# Altium schematic sheet LevelTranslator.SchDoc
size A4; SheetNumber: 1; SheetTotal: 1
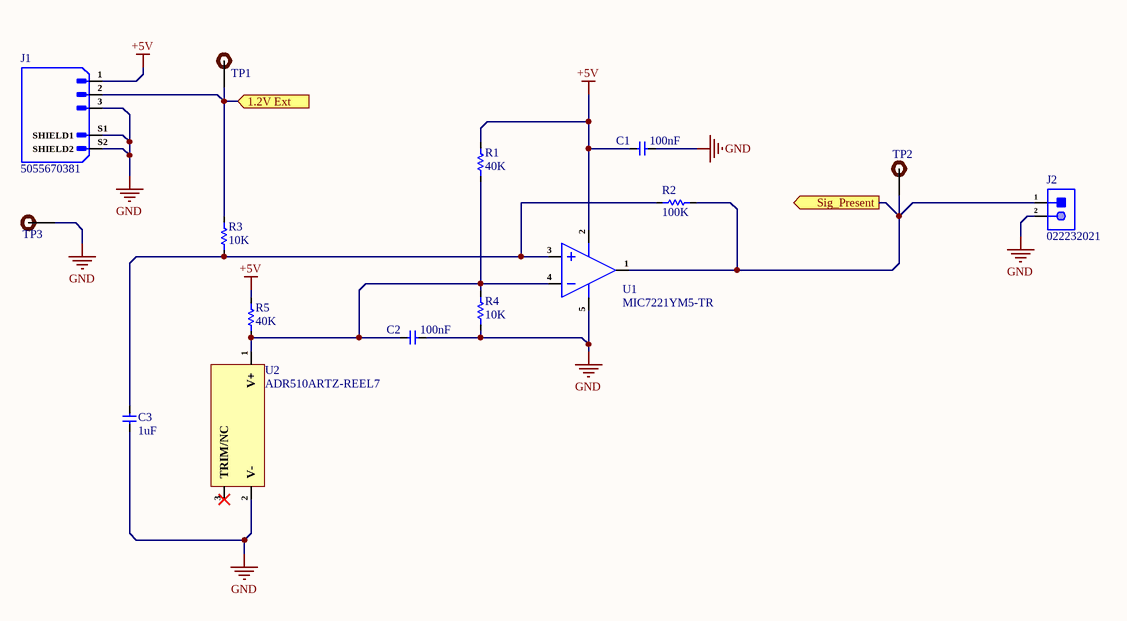
[diagram p0: LevelTranslator.SchDoc]

## Parts
C1  100nF  [Cap-0402]
C2  100nF  [Cap-0402]
C3  1uF  [Cap-0603]
J1  5055670381  [5055670381]
J2  022232021  [022232021]
R1  40K  [Res-0402]
R2  100K  [Res-0402]
R3  10K  [Res-0402]
R4  10K  [Res-0402]
R5  40K  [Res-0402]
TP1  0.5mm Test Pad  [0.5mm Test Pad]  (value not drawn)
TP2  0.5mm Test Pad  [0.5mm Test Pad]  (value not drawn)
TP3  0.5mm Test Pad  [0.5mm Test Pad]  (value not drawn)
U1  MIC7221YM5-TR  [SOT-23-5]
U2  ADR510ARTZ-REEL7  [SOT-23]

## Ports
1.2V Ext (in), Sig_Present (out)

## Nets
+5V: C1.1 J1.1 R1.2 R5.2 U1.2(V+)
GND: C1.2 C2.2 C3.1 J1.3 J1.S1(SHIELD1) J1.S2(SHIELD2) J2.2 R4.1 TP3.1 U1.5(V-) U2.2(V-)
1.2V Ext: J1.2 R3.2 TP1.1 ; port 1.2V Ext
Sig_Present: J2.1 R2.2 TP2.1 U1.1(OUT) ; port Sig_Present
NetC2_1: C2.1 R1.1 R4.2 R5.1 U1.4(IN-) U2.1(V+)
NetC3_2: C3.2 R2.1 R3.1 U1.3(IN+)

Not connected (* = marked no-connect by the designer): U2 3(TRIM/NC)*

## Notes on the sheet
- File:
- Title:
- Date:
- Page
- Num:
- Total:
- Drawn By: Huzaifa Ali

## Library data of the parts
C1 C2 = CC0402KRX5R8BB104: CAP CER 0.1UF 25V X5R 0402; Manufacturer: Yageo; Tolerance: 10%; Item Type: Capacitor; Supplier 1: Digi-Key; Manufacturer Part Number: CC0402KRX5R8BB104; RoHS: Yes; Category: Ceramic Capacitors; Stock 1: 4598218; Pricing 1: 1=0.10000, 10=0.03800, 50=0.02100, 100=0.01710, 500=0.01224, 1000=0.00961, 2500=0.00874, 5000=0.00804 (USD); Mount: Surface Mount; Case/Package: 0402; Case Code (Metric): 1005; Case Code (Imperial): 0402; Min Operating Temperature: -55°C; Max Operating Temperature: 85°C; Voltage Rating: 25V; Packaging: Tape and Reel; Capacitance: 100nF; Voltage Rating (DC): 25V; Dielectric: X5R; Resistor Type: Ceramic; Series: CC; Length: 0.039inch; Width: 0.02inch; Thickness: 0.022inch; Depth: 0.5mm; Lead Free: Lead Free; Halogen Free: Halogen Free; RoHS Compliant: Yes; ComponentLink1URL: http://www.mouser.com/ds/2/447/UPY-GPHC_X5R_4V-to-50V_25-1131599.pdf?src-supplier=Mouser; ComponentLink1Description: http://www.mouser.com/ds/2/447/UPY-GPHC_X5R_4V-to-50V_25-1131599.pdf?src-supplier=Mouser; ComponentLink2URL: http://www.yageo.com/documents/recent/UPY-GPHC_X5R_4V-to-50V-16.pdf?src-supplier=Future+Electronics; ComponentLink2Description: http://www.yageo.com/documents/recent/UPY-GPHC_X5R_4V-to-50V-16.pdf?src-supplier=Future+Electronics; ComponentLink3URL: http://www.yageo.com/documents/recent/UPY-GPHC_X5R_4V-to-50V_25.pdf?src-supplier=Digi-Key; ComponentLink3Description: http://www.yageo.com/documents/recent/UPY-GPHC_X5R_4V-to-50V_25.pdf?src-supplier=Digi-Key; Supplier Part Number 1: 311-1697-1-ND; LCSC Part Number: C106256
C3 = CC0603KRX5R8BB105: CAP CER 1UF 25V X5R 0603; Manufacturer: Yageo; Tolerance: 10%; Item Type: Capacitor; Supplier 1: Digi-Key; Manufacturer Part Number: CC0603KRX5R8BB105; RoHS: Yes; Category: Ceramic Capacitors; Stock 1: 919939; Pricing 1: 1=0.12000, 10=0.08400, 50=0.04760, 100=0.03940, 500=0.02764, 1000=0.02288 (USD); Mount: Surface Mount; Case/Package: 0603; Number of Pins: 2; Case Code (Metric): 1608; Case Code (Imperial): 0603; Min Operating Temperature: -55°C; Max Operating Temperature: 85°C; Capacitance: 1uF; Dielectric: X5R; Package Quantity: 1; Voltage Rating: 25V; Packaging: Tape and Reel; Termination: SMD/SMT; Voltage Rating (DC): 25V; Series: CC; Construction: Flat; Length: 1.6mm; Width: 0.031inch; Height: 0.8mm; Thickness: 0.035inch; Depth: 0.8mm; Radiation Hardening: No; REACH SVHC: No SVHC; Lead Free: Lead Free; Halogen Free: Halogen Free; RoHS Compliant: Yes; ComponentLink1URL: https://datasheet.ciiva.com/176/mlccorderingcode-176785.pdf?src-supplier=Digi-Key; ComponentLink1Description: https://datasheet.ciiva.com/176/mlccorderingcode-176785.pdf?src-supplier=Digi-Key; ComponentLink2URL: https://datasheet.ciiva.com/176/mlccorderingcode-176786.pdf?src-supplier=Digi-Key; ComponentLink2Description: https://datasheet.ciiva.com/176/mlccorderingcode-176786.pdf?src-supplier=Digi-Key; ComponentLink3URL: https://datasheet.ciiva.com/176/mlccorderingcode-176787.pdf?src-supplier=Digi-Key; ComponentLink3Description: https://datasheet.ciiva.com/176/mlccorderingcode-176787.pdf?src-supplier=Digi-Key; ComponentLink4URL: https://datasheet.ciiva.com/17436/upy-gphc-x5r-4v-to-50v-12-17436952.pdf?src-supplier=Avnet+Europe; ComponentLink4Description: https://datasheet.ciiva.com/17436/upy-gphc-x5r-4v-to-50v-12-17436952.pdf?src-supplier=Avnet+Europe; ComponentLink5URL: https://datasheet.ciiva.com/7978/1525783-7978171.pdf?src-supplier=Element14; ComponentLink5Description: https://datasheet.ciiva.com/7978/1525783-7978171.pdf?src-supplier=Element14; ComponentLink6URL: https://datasheet.ciiva.com/11586/upy-gphc-x5r-4v-to-50v-12-11586318.pdf?src-supplier=Avnet; ComponentLink6Description: https://datasheet.ciiva.com/11586/upy-gphc-x5r-4v-to-50v-12-11586318.pdf?src-supplier=Avnet; Supplier Part Number 1: 311-1445-1-ND; LCSC Part Number: C14664
J1 = 5055670381: CONN HEADER SMD R/A 3POS 1.25MM; Manufacturer: Molex; Item Type: Headers and Wire Housings; Supplier: Mouser; Supplier Part Number: 538-505567-0381; Manufacturer Part Number: 5055670381; RoHS: Yes; Stock: 6126; Pricing: 1=0.94, 10=0.784, 50=0.784, 100=0.653, 1000=0.65, 10000=0.501 (USD); ComponentLink1URL: http://www.literature.molex.com/SQLImages/kelmscott/Molex/PDF_Images/987651-4888.PDF?src-supplier=Digikey; ComponentLink1Description: http://www.literature.molex.com/SQLImages/kelmscott/Molex/PDF_Images/987651-4888.PDF?src-supplier=Digikey
J2 = 022232021: CONN HEADER VERT 2POS 2.54MM; Manufacturer: Molex; Supplier: Mouser; Supplier Part Number: 538-22-23-2021; Manufacturer Part Number: 022232021; RoHS: No; Category: Uncategorized; Stock: 51848; Pricing: 1=0.21, 10=0.127, 50=0.127, 100=0.096, 1000=0.086, 10000=0.073 (USD)
R1 R5 = RNCF0402BTE40K0: RES SMD 40K OHM 0.1% 1/10W 0402; Manufacturer: Stackpole Electronics; Item Type: Chip SMD Resistors; Supplier: Digikey; Supplier Part Number: 738-RNCF0402BTE40K0CT-ND; Manufacturer Part Number: RNCF0402BTE40K0; RoHS: Yes; Stock: 8442; Pricing: 1=0.16, 10=0.12, 50=0.0946, 100=0.0846, 500=0.06416, 1000=0.05662, 5000=0.04184 (USD); ComponentLink1URL: http://datasheet.octopart.com/RNCF0402BTE40K0-Stackpole-Electronics-datasheet-12511394.pdf?src-supplier=Digikey; ComponentLink1Description: http://datasheet.octopart.com/RNCF0402BTE40K0-Stackpole-Electronics-datasheet-12511394.pdf?src-supplier=Digikey; ComponentLink2URL: http://datasheet.octopart.com/RNCF0402BTE40K0-Stackpole-Electronics-datasheet-12511394.pdf?src-supplier=NAC+Semi; ComponentLink2Description: http://datasheet.octopart.com/RNCF0402BTE40K0-Stackpole-Electronics-datasheet-12511394.pdf?src-supplier=NAC+Semi; ComponentLink3URL: https://datasheet.octopart.com/RNCF0402BTE40K0-Stackpole-Electronics-datasheet-154799225.pdf?src-supplier=Master+Electronics; ComponentLink3Description: https://datasheet.octopart.com/RNCF0402BTE40K0-Stackpole-Electronics-datasheet-154799225.pdf?src-supplier=Master+Electronics
R2 = RC0402FR-07100KL: RES 100K OHM 1% 1/16W 0402; Manufacturer: Yageo; Resistance: 100kR; Temperature Coefficient: 100ppm/°C; Power Rating: 63mW; Voltage Rating: 50V; Item Type: Resistor; Supplier 1: Mouser; Manufacturer Part Number: RC0402FR-07100KL; RoHS: Yes; Category: Chip SMD Resistors; Stock 1: 7759549; Pricing 1: 1=0.10000, 10=0.01200, 50=0.01200, 100=0.00500, 1000=0.00300, 2500=0.00200, 10000=0.00100 (USD); Case/Package: 0402; Case Code (Metric): 1005; Case Code (Imperial): 0402; Min Operating Temperature: -55°C; Max Operating Temperature: 155°C; Resistor Type: Thick Film; Tolerance: 1%; Packaging: Tape and Reel; Package Quantity: 1; Number of Terminations: 2; Termination: SMD/SMT; Max Power Dissipation: 63mW; Working Voltage: 50V; Features: Moisture Resistant; Series: RC; Resistance Tolerance: 1%; Construction: Rectangular; Technology: THICK FILM; Length: 0.039inch; Width: 0.02inch; Height: 0.016inch; Depth: 0.5mm; REACH SVHC: No SVHC; Lead Free: Lead Free; RoHS Compliant: Yes; Military Standard: Not; ComponentLink1URL: https://datasheet.ciiva.com/11819/0900766b80c66297-11819452.pdf?src-supplier=RSComponents; ComponentLink1Description: https://datasheet.ciiva.com/11819/0900766b80c66297-11819452.pdf?src-supplier=RSComponents; ComponentLink2URL: https://datasheet.ciiva.com/22747/1018594-22747509.pdf?src-supplier=Element14; ComponentLink2Description: https://datasheet.ciiva.com/22747/1018594-22747509.pdf?src-supplier=Element14; ComponentLink3URL: https://datasheet.ciiva.com/2453/pyu-r-int-thick-7-2453362.pdf?src-supplier=Digi-Key; ComponentLink3Description: https://datasheet.ciiva.com/2453/pyu-r-int-thick-7-2453362.pdf?src-supplier=Digi-Key; ComponentLink4URL: https://datasheet.ciiva.com/2453/pyu-r-int-thick-7-2453363.pdf?src-supplier=Digi-Key; ComponentLink4Description: https://datasheet.ciiva.com/2453/pyu-r-int-thick-7-2453363.pdf?src-supplier=Digi-Key; ComponentLink5URL: https://datasheet.ciiva.com/2453/pyu-r-int-thick-7-2453361.pdf?src-supplier=Digi-Key; ComponentLink5Description: https://datasheet.ciiva.com/2453/pyu-r-int-thick-7-2453361.pdf?src-supplier=Digi-Key; ComponentLink6URL: https://datasheet.ciiva.com/12667/pyu-rc0402-51-rohs-l-6-r-12667930.pdf?src-supplier=Mouser; ComponentLink6Description: https://datasheet.ciiva.com/12667/pyu-rc0402-51-rohs-l-6-r-12667930.pdf?src-supplier=Mouser; ComponentLink7URL: https://datasheet.ciiva.com/15189/getdatasheetpartid-323696-15189334.pdf?src-supplier=Verical; ComponentLink7Description: https://datasheet.ciiva.com/15189/getdatasheetpartid-323696-15189334.pdf?src-supplier=Verical; Supplier Part Number 1: 603-RC0402FR-07100KL; LCSC Part Number: C60491
R3 R4 = RC0402FR-0710KL: RES 10K OHM 1% 1/16W 0402; Manufacturer: Yageo; Resistance: 10kR; Voltage Rating (DC): 50V; Temperature Coefficient: 100ppm/°C; Power Rating: 62.5mW; Max Power Dissipation: 63mW; Item Type: Resistor; Supplier 1: Mouser; Manufacturer Part Number: RC0402FR-0710KL; RoHS: Yes; Category: Chip SMD Resistors; Stock 1: 18648329; Pricing 1: 1=0.10000, 10=0.01400, 50=0.01400, 100=0.00500, 1000=0.00300, 10000=0.00200 (USD); Case/Package: 0402; Number of Pins: 2; Case Code (Imperial): 0402; Case Code (Metric): 1005; Min Operating Temperature: -55°C; Max Operating Temperature: 155°C; Resistor Type: Thick Film; Tolerance: 1%; Packaging: Tape and Reel; Voltage Rating: 50V; Termination: SMD/SMT; Working Voltage: 50V; Number of Terminations: 2; Features: Moisture Resistant; Series: RC; Resistance Tolerance: 1%; Construction: Rectangular; Length: 1mm; Width: 0.5mm; Height: 0.32mm; Depth: 0.5mm; Lead Pitch: 0.2mm; REACH SVHC: No SVHC; Lead Free: Lead Free; RoHS Compliant: Yes; Military Standard: Not; ComponentLink1URL: https://datasheet.ciiva.com/7660/38568-7660787.pdf?src-supplier=Element14; ComponentLink1Description: https://datasheet.ciiva.com/7660/38568-7660787.pdf?src-supplier=Element14; ComponentLink2URL: https://datasheet.ciiva.com/7849/1686128-7849814.pdf?src-supplier=Element14; ComponentLink2Description: https://datasheet.ciiva.com/7849/1686128-7849814.pdf?src-supplier=Element14; ComponentLink3URL: https://datasheet.ciiva.com/7983/1018594-7983486.pdf?src-supplier=Element14; ComponentLink3Description: https://datasheet.ciiva.com/7983/1018594-7983486.pdf?src-supplier=Element14; ComponentLink4URL: https://datasheet.ciiva.com/22747/1018594-22747512.pdf?src-supplier=Element14; ComponentLink4Description: https://datasheet.ciiva.com/22747/1018594-22747512.pdf?src-supplier=Element14; ComponentLink5URL: https://datasheet.ciiva.com/12667/pyu-rc0402-51-rohs-l-6-r-12667067.pdf?src-supplier=Mouser; ComponentLink5Description: https://datasheet.ciiva.com/12667/pyu-rc0402-51-rohs-l-6-r-12667067.pdf?src-supplier=Mouser; ComponentLink6URL: https://datasheet.ciiva.com/7849/1784430-7849813.pdf?src-supplier=Element14; ComponentLink6Description: https://datasheet.ciiva.com/7849/1784430-7849813.pdf?src-supplier=Element14; ComponentLink7URL: https://datasheet.ciiva.com/7849/1784430-7849815.pdf?src-supplier=Element14; ComponentLink7Description: https://datasheet.ciiva.com/7849/1784430-7849815.pdf?src-supplier=Element14; Supplier Part Number 1: 603-RC0402FR-0710KL; LCSC Part Number: C60490
TP1-TP3 = 0.5mm Test Pad: Test pad
U1 = MIC7221YM5-TR: IC COMPARATOR 1 GEN PUR SOT23-5; Manufacturer: Microchip; Item Type: Comparators; Supplier: Digikey; Supplier Part Number: 576-2901-1-ND; Manufacturer Part Number: MIC7221YM5-TR; RoHS: Yes; Stock: 26283; Pricing: 1=0.37, 25=0.32, 100=0.3 (USD)
U2 = ADR510ARTZ-REEL7: IC VREF SHUNT 0.35% SOT23-3; Manufacturer: Analog Devices; Item Type: Voltage References; Supplier: Mouser; Supplier Part Number: 584-ADR510ARTZ-R7; Manufacturer Part Number: ADR510ARTZ-REEL7; RoHS: Yes; Stock: 28687; Pricing: 1=2.35, 10=2, 50=2, 100=1.69, 1000=1.14, 10000=1.03 (USD); ComponentLink1URL: https://datasheet.ciiva.com/1172/81404-1172803.pdf?src-supplier=Element14; ComponentLink1Description: https://datasheet.ciiva.com/1172/81404-1172803.pdf?src-supplier=Element14; ComponentLink2URL: https://datasheet.ciiva.com/15373/adr510-279234-15373251.pdf?src-supplier=Mouser; ComponentLink2Description: https://datasheet.ciiva.com/15373/adr510-279234-15373251.pdf?src-supplier=Mouser; ComponentLink3URL: https://datasheet.ciiva.com/28474/81404-28474005.pdf?src-supplier=Element14; ComponentLink3Description: https://datasheet.ciiva.com/28474/81404-28474005.pdf?src-supplier=Element14; ComponentLink4URL: https://datasheet.ciiva.com/3235/adr510-3235758.pdf?src-supplier=Avnet; ComponentLink4Description: https://datasheet.ciiva.com/3235/adr510-3235758.pdf?src-supplier=Avnet; ComponentLink5URL: https://datasheet.ciiva.com/3235/adr510-3235291.pdf?src-supplier=Avnet; ComponentLink5Description: https://datasheet.ciiva.com/3235/adr510-3235291.pdf?src-supplier=Avnet; ComponentLink6URL: https://datasheet.ciiva.com/2005/adr510-2005628.pdf?src-supplier=Digikey; ComponentLink6Description: https://datasheet.ciiva.com/2005/adr510-2005628.pdf?src-supplier=Digikey; ComponentLink7URL: https://datasheet.ciiva.com/2005/adr510-2005629.pdf?src-supplier=Digikey; ComponentLink7Description: https://datasheet.ciiva.com/2005/adr510-2005629.pdf?src-supplier=Digikey; ComponentLink8URL: https://datasheet.ciiva.com/2005/adr510-2005630.pdf?src-supplier=Digikey; ComponentLink8Description: https://datasheet.ciiva.com/2005/adr510-2005630.pdf?src-supplier=Digikey